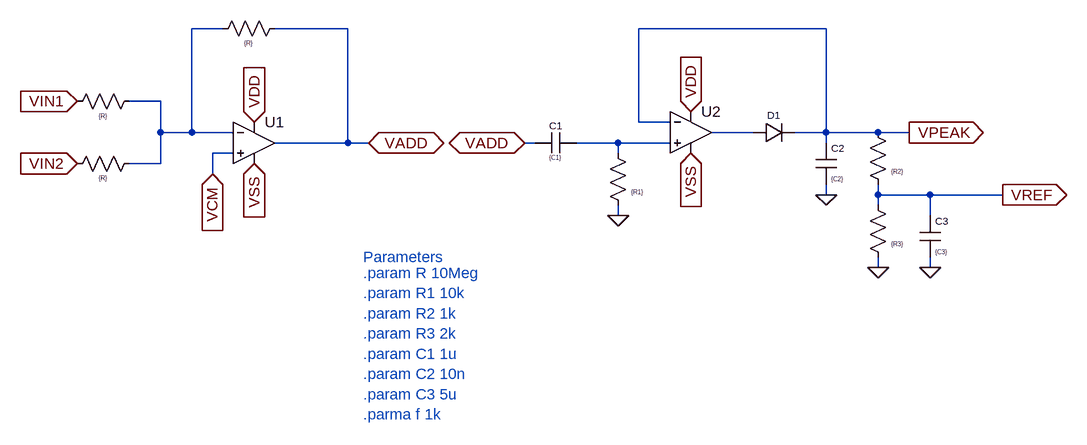
[diagram p0: schematic exp7-block.asc]
exp7-block.asc, the LTspice schematic file:
Version 4
SHEET 1 1368 680
WIRE 64 112 16 112
WIRE 256 112 144 112
WIRE 992 112 704 112
WIRE -32 224 -80 224
WIRE 704 256 704 112
WIRE 752 256 704 256
WIRE -32 272 -32 224
WIRE 16 272 16 112
WIRE 16 272 -32 272
WIRE 80 272 16 272
WIRE 880 272 816 272
WIRE 992 272 992 112
WIRE 992 272 944 272
WIRE 1072 272 992 272
WIRE 1120 272 1072 272
WIRE 256 288 256 112
WIRE 256 288 144 288
WIRE 288 288 256 288
WIRE 544 288 528 288
WIRE 672 288 608 288
WIRE 752 288 672 288
WIRE 992 288 992 272
WIRE 80 304 48 304
WIRE 672 304 672 288
WIRE -32 320 -32 272
WIRE -32 320 -80 320
WIRE 48 336 48 304
WIRE 992 368 992 352
WIRE 1072 368 1072 352
WIRE 1152 368 1072 368
WIRE 1264 368 1152 368
WIRE 1072 384 1072 368
WIRE 672 400 672 384
WIRE 1152 400 1152 368
WIRE 1072 480 1072 464
WIRE 1152 480 1152 464
FLAG 112 256 VDD
IOPIN 112 256 In
FLAG 112 320 VSS
IOPIN 112 320 In
FLAG 48 336 VCM
IOPIN 48 336 In
FLAG -160 224 VIN1
IOPIN -160 224 In
FLAG -160 320 VIN2
IOPIN -160 320 In
FLAG 672 400 0
FLAG 784 240 VDD
IOPIN 784 240 In
FLAG 784 304 VSS
IOPIN 784 304 In
FLAG 992 368 0
FLAG 1152 480 0
FLAG 1072 480 0
FLAG 288 288 VADD
IOPIN 288 288 BiDir
FLAG 528 288 VADD
IOPIN 528 288 BiDir
FLAG 1264 368 VREF
IOPIN 1264 368 Out
FLAG 1120 272 VPEAK
IOPIN 1120 272 Out
SYMBOL res -64 208 R90
WINDOW 0 0 56 Invisible 2
WINDOW 3 32 56 VTop 0
SYMATTR InstName R1
SYMATTR Value {R}
SYMBOL res -64 304 R90
WINDOW 0 0 56 Invisible 2
WINDOW 3 32 56 VTop 0
SYMATTR InstName R2
SYMATTR Value {R}
SYMBOL cap 608 272 R90
WINDOW 0 0 32 VBottom 1
WINDOW 3 32 32 VTop 0
SYMATTR InstName C1
SYMATTR Value {C1}
SYMBOL res 656 288 R0
WINDOW 0 36 40 Invisible 1
WINDOW 3 36 76 Left 0
SYMATTR InstName R3
SYMATTR Value {R1}
SYMBOL diode 880 288 R270
WINDOW 0 32 32 VTop 1
WINDOW 3 0 32 Invisible 2
SYMATTR InstName D1
SYMATTR Value 1N4148
SYMBOL cap 976 288 R0
WINDOW 0 24 8 Left 1
WINDOW 3 24 56 Left 0
SYMATTR InstName C2
SYMATTR Value {C2}
SYMBOL res 1056 256 R0
WINDOW 0 36 40 Invisible 1
WINDOW 3 36 76 Left 0
SYMATTR InstName R4
SYMATTR Value {R2}
SYMBOL res 1056 368 R0
WINDOW 0 36 40 Invisible 1
WINDOW 3 36 76 Left 0
SYMATTR InstName R5
SYMATTR Value {R3}
SYMBOL cap 1136 400 R0
WINDOW 0 24 8 Left 1
WINDOW 3 24 56 Left 0
SYMATTR InstName C3
SYMATTR Value {C3}
SYMBOL res 160 96 R90
WINDOW 0 0 56 Invisible 2
WINDOW 3 32 56 VTop 0
SYMATTR InstName R6
SYMATTR Value {R}
SYMBOL Opamps/UniversalOpamp2 112 288 R0
SYMATTR InstName U1
SYMBOL Opamps/UniversalOpamp2 784 272 R0
SYMATTR InstName U2
TEXT 280 464 Left 2 ;Parameters
TEXT 280 488 Left 2 ;.param R 10Meg\n.param R1 10k\n.param R2 1k\n.param R3 2k\n.param C1 1u\n.param C2 10n\n.param C3 5u\n.parma f 1k

The netlist it stands for:
* exp7-block.asc
R1 N001 VIN1 {R}
R2 N001 VIN2 {R}
C1 N003 VADD {C1}
R3 N003 0 {R1}
D1 N002 VPEAK 1N4148
C2 VPEAK 0 {C2}
R4 VPEAK VREF {R2}
R5 VREF 0 {R3}
C3 VREF 0 {C3}
R6 VADD N001 {R}
XU1 VCM N001 VDD VSS VADD level.2 Avol=1Meg GBW=10Meg Slew=10Meg ilimit=25m rail=0 Vos=0 phimargin=45 en=0 enk=0 in=0 ink=0 Rin=500Meg  ; pins IN+ IN- V+ V- OUT
XU2 N003 VPEAK VDD VSS N002 level.2 Avol=1Meg GBW=10Meg Slew=10Meg ilimit=25m rail=0 Vos=0 phimargin=45 en=0 enk=0 in=0 ink=0 Rin=500Meg  ; pins IN+ IN- V+ V- OUT
.model D D
.lib standard.dio
* Parameters
* .param R 10Meg
* .param R1 10k
* .param R2 1k
* .param R3 2k
* .param C1 1u
* .param C2 10n
* .param C3 5u
* .parma f 1k
.lib UniversalOpamps2.sub
.backanno
.end